# Altium schematic sheet [07] - EXPANSION INTERFACE AND JTAG.SchDoc
size A2; DocumentNumber: 2; SheetNumber: 7; SheetTotal: 10
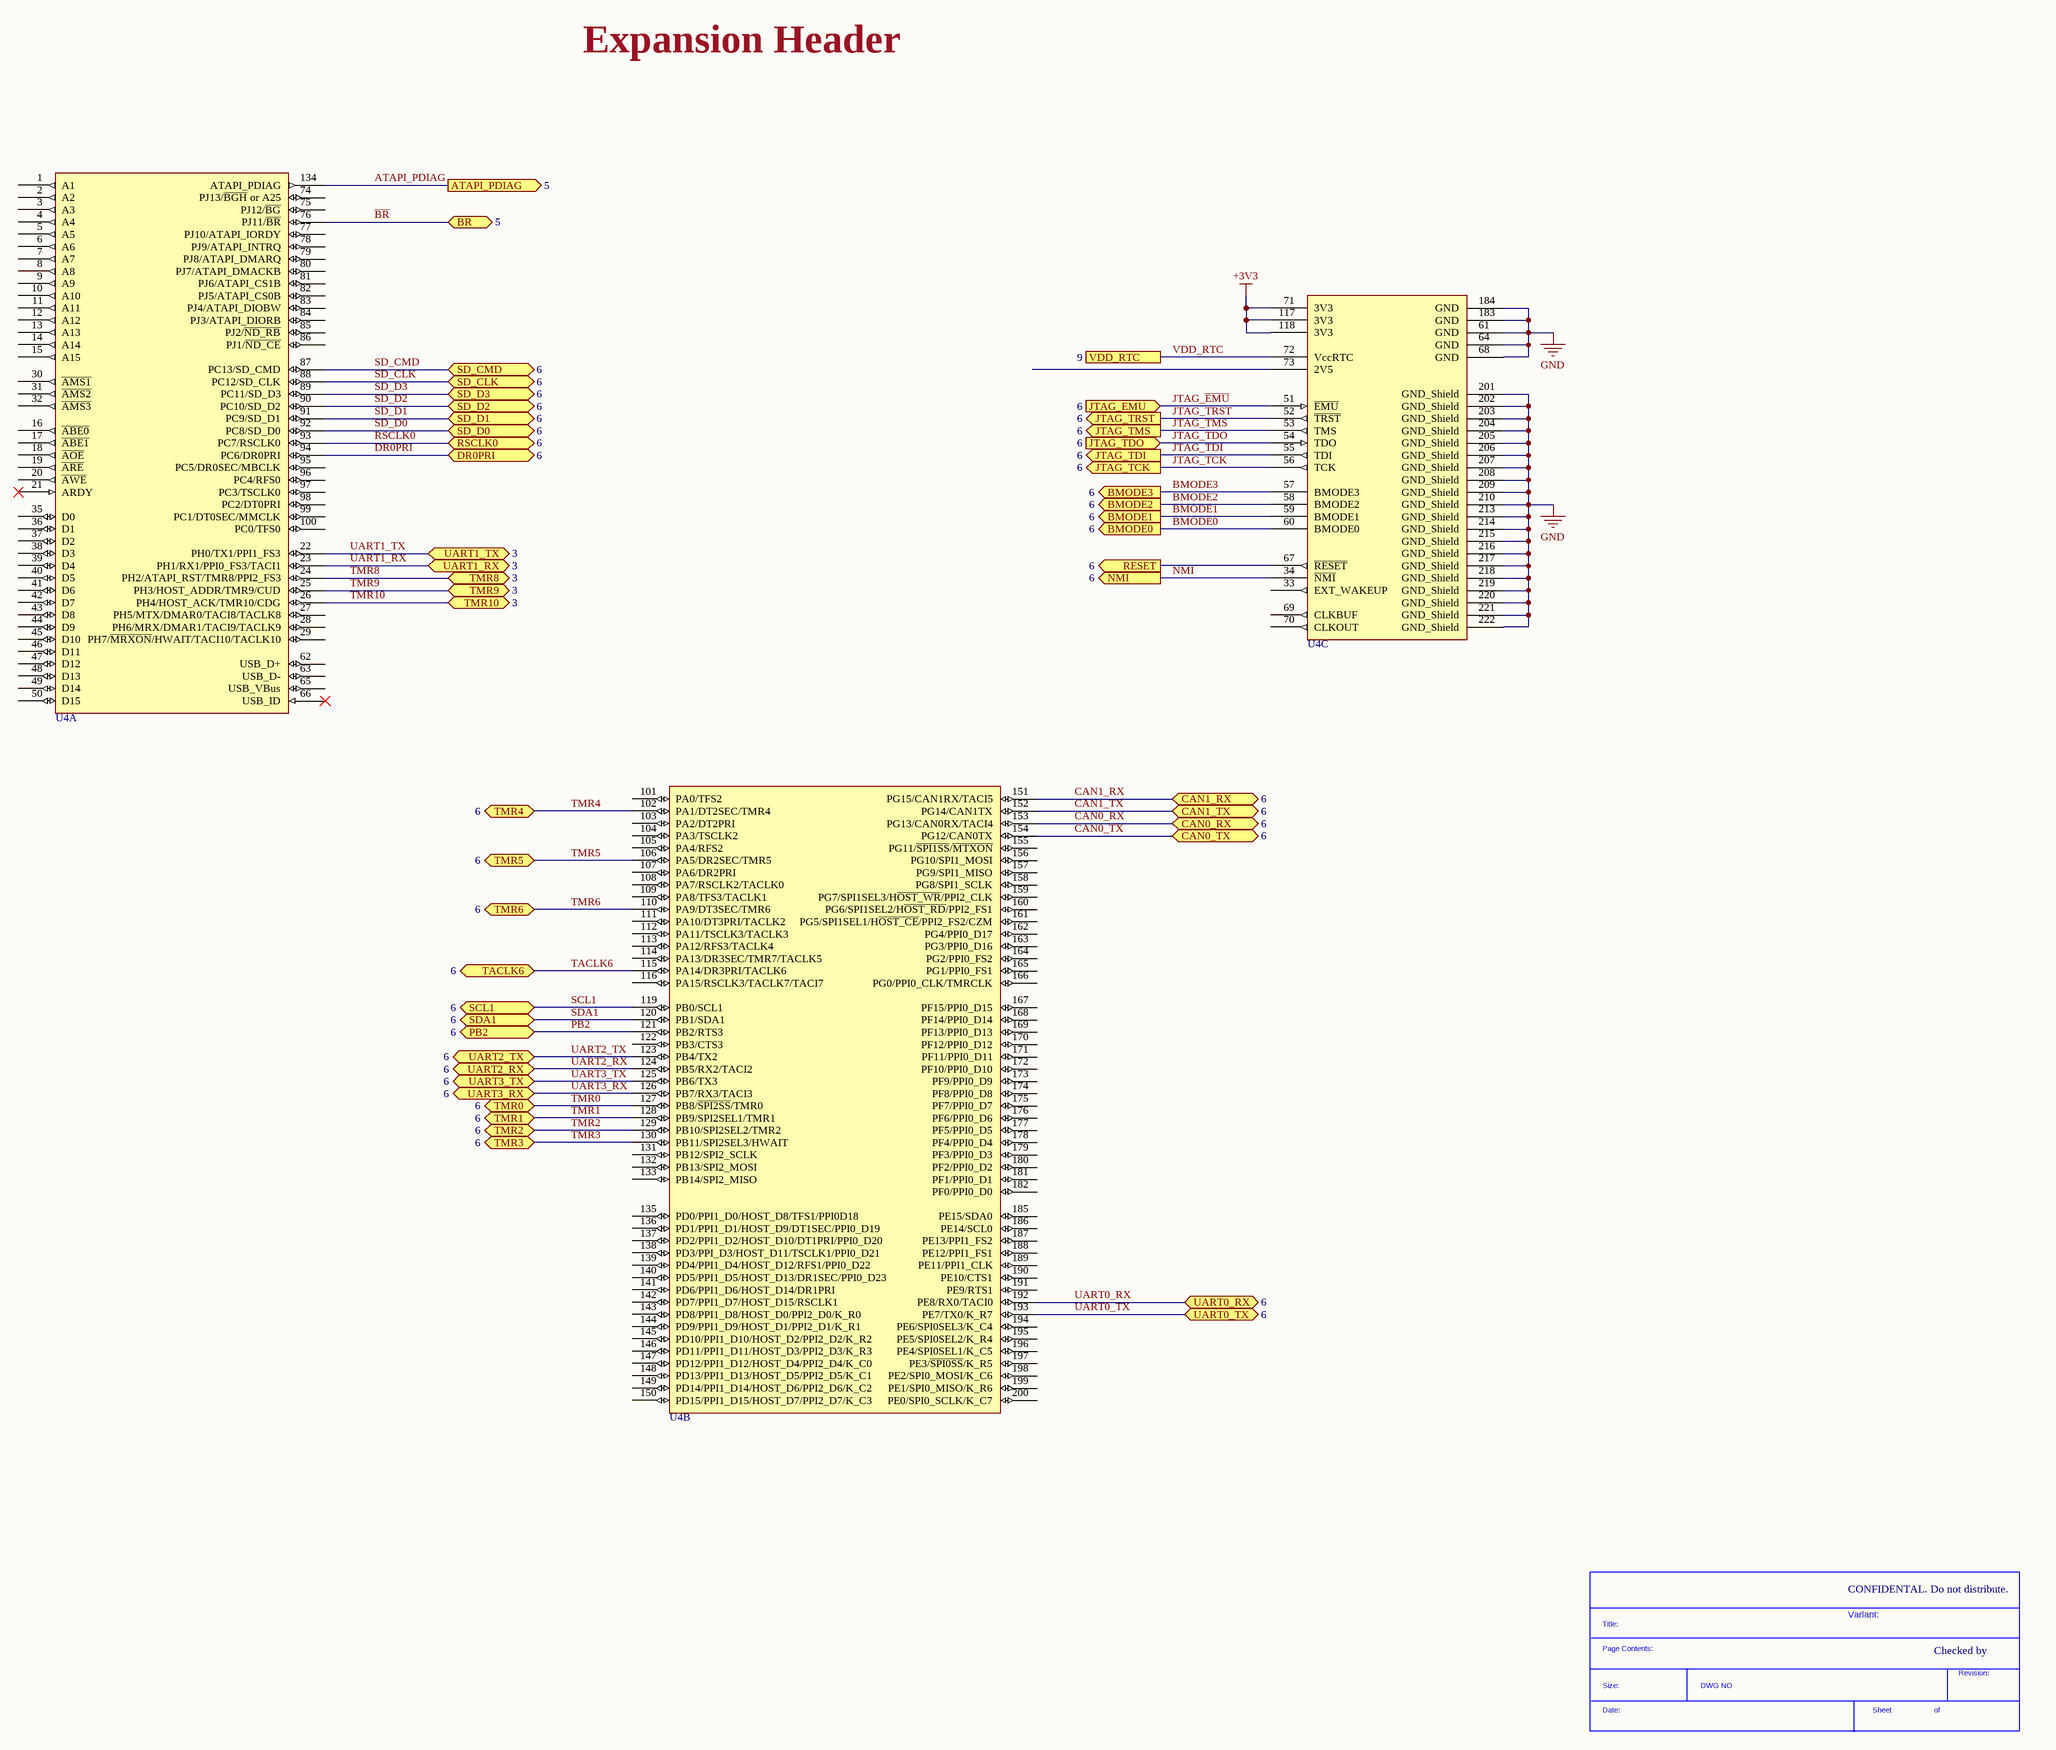
[diagram p0: [07] - EXPANSION INTERFACE AND JTAG.SchDoc]

## Parts
*  SDTitleBlock  (value not drawn)  (graphical)
U4  CM-BF548  [CM-BF548-ORIGIN]  (value not drawn)  (parts A,B,C of 3)

## Ports
ATAPI_PDIAG (out, see 5), BMODE0 (out, see 6), BMODE1 (out, see 6), BMODE2 (out, see 6), BMODE3 (out, see 6), BR (bidir, see 5), CAN0_RX (bidir, see 6), CAN0_TX (bidir, see 6), CAN1_RX (bidir, see 6), CAN1_TX (bidir, see 6), DR0PRI (bidir, see 6), JTAG_EMU (in, see 6), JTAG_TCK (out, see 6), JTAG_TDI (out, see 6), JTAG_TDO (in, see 6), JTAG_TMS (out, see 6), JTAG_TRST (out, see 6), NMI (out, see 6), PB2 (bidir, see 6), RESET (out, see 6), RSCLK0 (bidir, see 6), SCL1 (bidir, see 6), SD_CLK (bidir, see 6), SD_CMD (bidir, see 6), SD_D0 (bidir, see 6), SD_D1 (bidir, see 6), SD_D2 (bidir, see 6), SD_D3 (bidir, see 6), SDA1 (bidir, see 6), TACLK6 (bidir, see 6), TMR0 (bidir, see 6), TMR1 (bidir, see 6), TMR2 (bidir, see 6), TMR3 (bidir, see 6), TMR4 (bidir, see 6), TMR5 (bidir, see 6), TMR6 (bidir, see 6), TMR8 (bidir, see 3), TMR9 (bidir, see 3), TMR10 (bidir, see 3), UART0_RX (bidir, see 6), UART0_TX (bidir, see 6), UART1_RX (bidir, see 3), UART1_TX (bidir, see 3), UART2_RX (bidir, see 6), UART2_TX (bidir, see 6), UART3_RX (bidir, see 6), UART3_TX (bidir, see 6), VDD_RTC (see 9)

## Nets
+3V3: U4.71(3V3) U4.117(3V3) U4.118(3V3)
GND: U4.61(GND) U4.64(GND) U4.68(GND) U4.183(GND) U4.184(GND) U4.201(GND_Shield) U4.202(GND_Shield) U4.203(GND_Shield) U4.204(GND_Shield) U4.205(GND_Shield) U4.206(GND_Shield) U4.207(GND_Shield) U4.208(GND_Shield) U4.209(GND_Shield) U4.210(GND_Shield) U4.213(GND_Shield) U4.214(GND_Shield) U4.215(GND_Shield) U4.216(GND_Shield) U4.217(GND_Shield) U4.218(GND_Shield) U4.219(GND_Shield) U4.220(GND_Shield) U4.221(GND_Shield) U4.222(GND_Shield)
ATAPI_PDIAG: U4.134(ATAPI_PDIAG) ; port ATAPI_PDIAG
~{BR}: U4.76(PJ11/~{BR}) ; port BR
BMODE0: U4.60(BMODE0) ; port BMODE0
BMODE1: U4.59(BMODE1) ; port BMODE1
BMODE2: U4.58(BMODE2) ; port BMODE2
BMODE3: U4.57(BMODE3) ; port BMODE3
CAN0_RX: U4.153(PG13/CAN0RX/TACI4) ; port CAN0_RX
CAN0_TX: U4.154(PG12/CAN0TX) ; port CAN0_TX
CAN1_RX: U4.151(PG15/CAN1RX/TACI5) ; port CAN1_RX
CAN1_TX: U4.152(PG14/CAN1TX) ; port CAN1_TX
DR0PRI: U4.94(PC6/DR0PRI) ; port DR0PRI
JTAG_~{EMU}: U4.51(~{EMU}) ; port JTAG_EMU
JTAG_~{TRST}: U4.52(~{TRST}) ; port JTAG_TRST
JTAG_TCK: U4.56(TCK) ; port JTAG_TCK
JTAG_TDI: U4.55(TDI) ; port JTAG_TDI
JTAG_TDO: U4.54(TDO) ; port JTAG_TDO
JTAG_TMS: U4.53(TMS) ; port JTAG_TMS
~{NMI}: U4.34(~{NMI}) ; port NMI
PB2: U4.121(PB2/RTS3) ; port PB2
RESET: U4.67(~{RESET}) ; port RESET
RSCLK0: U4.93(PC7/RSCLK0) ; port RSCLK0
SCL1: U4.119(PB0/SCL1) ; port SCL1
SD_CLK: U4.88(PC12/SD_CLK) ; port SD_CLK
SD_CMD: U4.87(PC13/SD_CMD) ; port SD_CMD
SD_D0: U4.92(PC8/SD_D0) ; port SD_D0
SD_D1: U4.91(PC9/SD_D1) ; port SD_D1
SD_D2: U4.90(PC10/SD_D2) ; port SD_D2
SD_D3: U4.89(PC11/SD_D3) ; port SD_D3
SDA1: U4.120(PB1/SDA1) ; port SDA1
TACLK6: U4.115(PA14/DR3PRI/TACLK6) ; port TACLK6
TMR0: U4.127(PB8/~{SPI2SS}/TMR0) ; port TMR0
TMR1: U4.128(PB9/SPI2SEL1/TMR1) ; port TMR1
TMR2: U4.129(PB10/SPI2SEL2/TMR2) ; port TMR2
TMR3: U4.130(PB11/SPI2SEL3/HWAIT) ; port TMR3
TMR4: U4.102(PA1/DT2SEC/TMR4) ; port TMR4
TMR5: U4.106(PA5/DR2SEC/TMR5) ; port TMR5
TMR6: U4.110(PA9/DT3SEC/TMR6) ; port TMR6
TMR8: U4.24(PH2/ATAPI_RST/TMR8/PPI2_FS3) ; port TMR8
TMR9: U4.25(PH3/HOST_ADDR/TMR9/CUD) ; port TMR9
TMR10: U4.26(PH4/HOST_ACK/TMR10/CDG) ; port TMR10
UART0_RX: U4.192(PE8/RX0/TACI0) ; port UART0_RX
UART0_TX: U4.193(PE7/TX0/K_R7) ; port UART0_TX
UART1_RX: U4.23(PH1/RX1/PPI0_FS3/TACI1) ; port UART1_RX
UART1_TX: U4.22(PH0/TX1/PPI1_FS3) ; port UART1_TX
UART2_RX: U4.124(PB5/RX2/TACI2) ; port UART2_RX
UART2_TX: U4.123(PB4/TX2) ; port UART2_TX
UART3_RX: U4.126(PB7/RX3/TACI3) ; port UART3_RX
UART3_TX: U4.125(PB6/TX3) ; port UART3_TX
VDD_RTC: U4.72(VccRTC) ; port VDD_RTC

Not connected (* = marked no-connect by the designer): U4 1(A1) 2(A2) 3(A3) 4(A4) 5(A5) 6(A6) 7(A7) 8(A8) 9(A9) 10(A10) 11(A11) 12(A12) 13(A13) 14(A14) 15(A15) 16(~{ABE0}) 17(~{ABE1}) 18(~{AOE}) 19(~{ARE}) 20(~{AWE}) 21(ARDY)* 27(PH5/MTX/DMAR0/TACI8/TACLK8) 28(PH6/MRX/DMAR1/TACI9/TACLK9) 29(PH7/~{MRXON}/HWAIT/TACI10/TACLK10) 30(~{AMS1}) 31(~{AMS2}) 32(~{AMS3}) 33(EXT_WAKEUP) 35(D0) 36(D1) 37(D2) 38(D3) 39(D4) 40(D5) 41(D6) 42(D7) 43(D8) 44(D9) 45(D10) 46(D11) 47(D12) 48(D13) 49(D14) 50(D15) 62(USB_D+) 63(USB_D-) 65(USB_VBus) 66(USB_ID)* 69(CLKBUF) 70(CLKOUT) 73(2V5) 74(PJ13/~{BGH}_or_A25) 75(PJ12/~{BG}) 77(PJ10/ATAPI_IORDY) 78(PJ9/ATAPI_INTRQ) 79(PJ8/ATAPI_DMARQ) 80(PJ7/ATAPI_DMACKB) 81(PJ6/ATAPI_CS1B) 82(PJ5/ATAPI_CS0B) 83(PJ4/ATAPI_DIOBW) 84(PJ3/ATAPI_DIORB) 85(PJ2/~{ND_RB}) 86(PJ1/~{ND_CE}) 95(PC5/DR0SEC/MBCLK) 96(PC4/RFS0) 97(PC3/TSCLK0) 98(PC2/DT0PRI) 99(PC1/DT0SEC/MMCLK) 100(PC0/TFS0) 101(PA0/TFS2) 103(PA2/DT2PRI) 104(PA3/TSCLK2) 105(PA4/RFS2) 107(PA6/DR2PRI) 108(PA7/RSCLK2/TACLK0) 109(PA8/TFS3/TACLK1) 111(PA10/DT3PRI/TACLK2) 112(PA11/TSCLK3/TACLK3) 113(PA12/RFS3/TACLK4) 114(PA13/DR3SEC/TMR7/TACLK5) 116(PA15/RSCLK3/TACLK7/TACI7) 122(PB3/CTS3) 131(PB12/SPI2_SCLK) 132(PB13/SPI2_MOSI) 133(PB14/SPI2_MISO) 135(PD0/PPI1_D0/HOST_D8/TFS1/PPI0D18) 136(PD1/PPI1_D1/HOST_D9/DT1SEC/PPI0_D19) 137(PD2/PPI1_D2/HOST_D10/DT1PRI/PPI0_D20) 138(PD3/PPI_D3/HOST_D11/TSCLK1/PPI0_D21) 139(PD4/PPI1_D4/HOST_D12/RFS1/PPI0_D22) 140(PD5/PPI1_D5/HOST_D13/DR1SEC/PPI0_D23) 141(PD6/PPI1_D6/HOST_D14/DR1PRI) 142(PD7/PPI1_D7/HOST_D15/RSCLK1) 143(PD8/PPI1_D8/HOST_D0/PPI2_D0/K_R0) 144(PD9/PPI1_D9/HOST_D1/PPI2_D1/K_R1) 145(PD10/PPI1_D10/HOST_D2/PPI2_D2/K_R2) 146(PD11/PPI1_D11/HOST_D3/PPI2_D3/K_R3) 147(PD12/PPI1_D12/HOST_D4/PPI2_D4/K_C0) 148(PD13/PPI1_D13/HOST_D5/PPI2_D5/K_C1) 149(PD14/PPI1_D14/HOST_D6/PPI2_D6/K_C2) 150(PD15/PPI1_D15/HOST_D7/PPI2_D7/K_C3) 155(PG11/~{SPI1SS}/~{MTXON}) 156(PG10/SPI1_MOSI) 157(PG9/SPI1_MISO) 158(PG8/SPI1_SCLK) 159(PG7/SPI1SEL3/H~{OST_WR}/PPI2_CLK) 160(PG6/SPI1SEL2/H~{OST_RD}/PPI2_FS1) 161(PG5/SPI1SEL1/H~{OST_CE}/PPI2_FS2/CZM) 162(PG4/PPI0_D17) 163(PG3/PPI0_D16) 164(PG2/PPI0_FS2) 165(PG1/PPI0_FS1) 166(PG0/PPI0_CLK/TMRCLK) 167(PF15/PPI0_D15) 168(PF14/PPI0_D14) 169(PF13/PPI0_D13) 170(PF12/PPI0_D12) 171(PF11/PPI0_D11) 172(PF10/PPI0_D10) 173(PF9/PPI0_D9) 174(PF8/PPI0_D8) 175(PF7/PPI0_D7) 176(PF6/PPI0_D6) 177(PF5/PPI0_D5) 178(PF4/PPI0_D4) 179(PF3/PPI0_D3) 180(PF2/PPI0_D2) 181(PF1/PPI0_D1) 182(PF0/PPI0_D0) 185(PE15/SDA0) 186(PE14/SCL0) 187(PE13/PPI1_FS2) 188(PE12/PPI1_FS1) 189(PE11/PPI1_CLK) 190(PE10/CTS1) 191(PE9/RTS1) 194(PE6/SPI0SEL3/K_C4) 195(PE5/SPI0SEL2/K_R4) 196(PE4/SPI0SEL1/K_C5) 197(PE3/~{SPI0SS}/K_R5) 198(PE2/SPI0_MOSI/K_C6) 199(PE1/SPI0_MISO/K_R6) 200(PE0/SPI0_SCLK/K_C7)

## Notes on the sheet
- Expansion Header
- CLOCKS (CPU & PCIE)
- CONFIDENTAL. Do not distribute.
- Variant:
- Checked by
- (in symbol SDTitleBlock) Title:; Page Contents:; Revision:; Size:; DWG NO; Date:; Sheet; of